# Altium schematic sheet Sensors.SchDoc
size A3; SheetNumber: 4; SheetTotal: 6
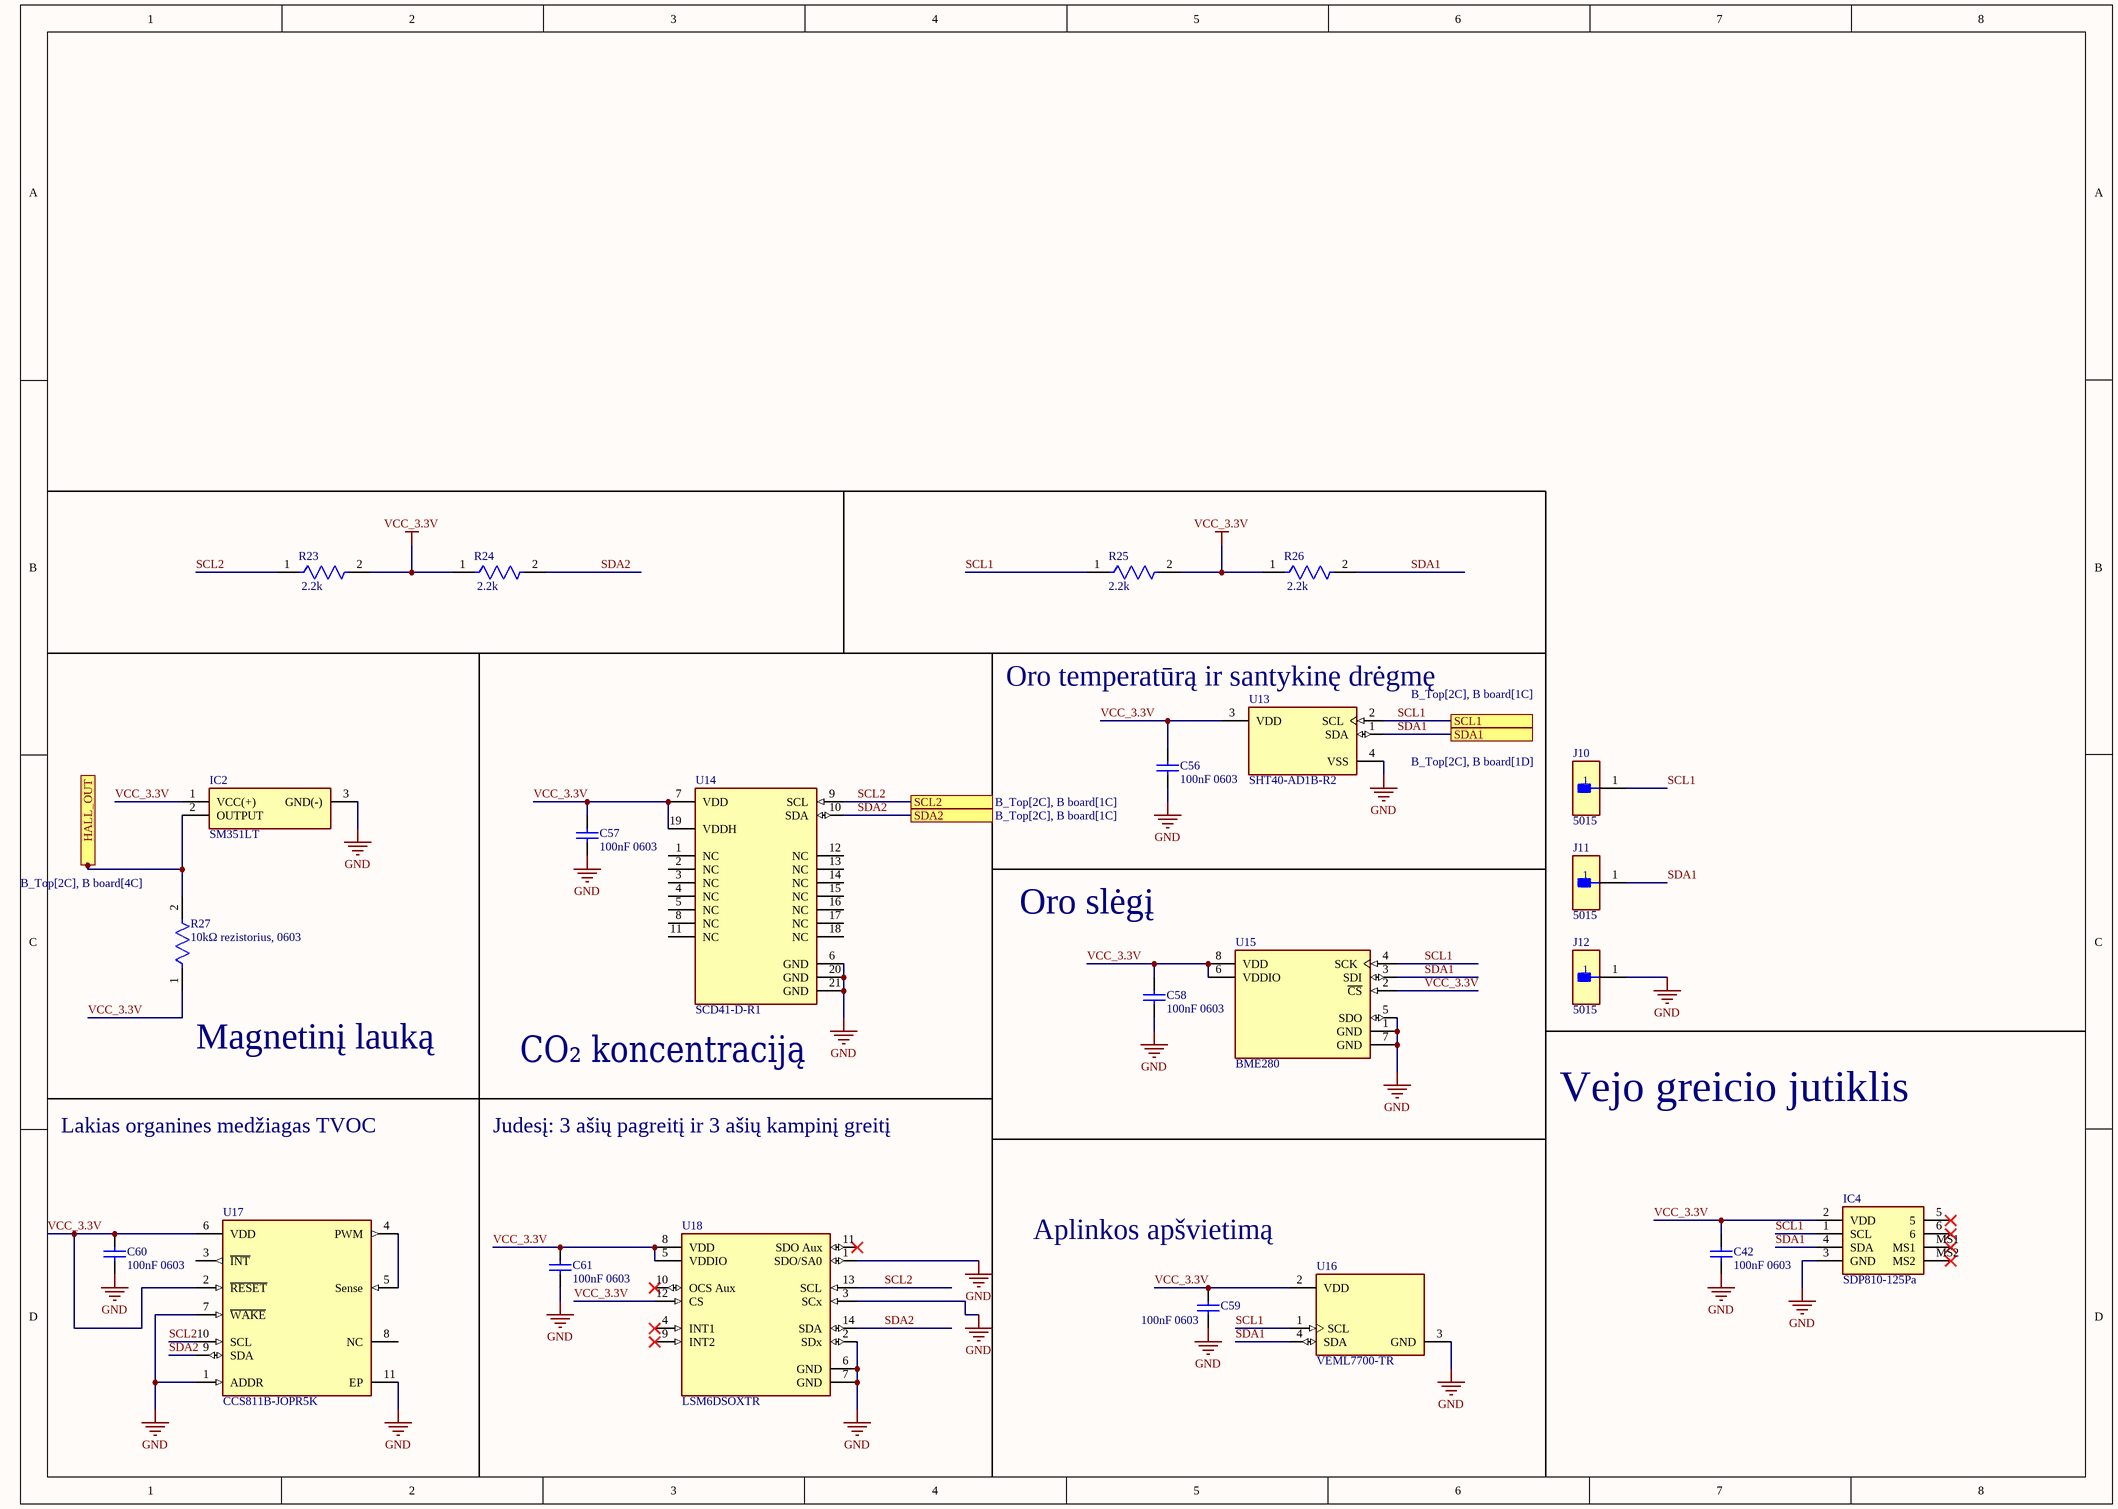
[diagram p0: Sensors.SchDoc]

## Parts
C42  100nF 0603  [CAPC1608X90X35NL15T15]
C56  100nF 0603  [CAPC1608X90X35NL15T15]
C57  100nF 0603  [CAPC1608X90X35NL15T15]
C58  100nF 0603  [CAPC1608X90X35NL15T15]
C59  100nF 0603  [CAPC1608X90X35NL15T15]
C60  100nF 0603  [CAPC1608X90X35NL15T15]
C61  100nF 0603  [CAPC1608X90X35NL15T15]
IC2  SM351LT  [SOT95P280X140-3N]
IC4  SDP810-125Pa  [SDP810125Pa]
J10  5015  [FP-5015-MFG]
J11  5015  [FP-5015-MFG]
J12  5015  [FP-5015-MFG]
R23  2.2k  [FP-RMCF0603-IPC_C]
R24  2.2k  [FP-RMCF0603-IPC_C]
R25  2.2k  [FP-RMCF0603-IPC_C]
R26  2.2k  [FP-RMCF0603-IPC_C]
R27  10kΩ rezistorius, 0603  [FP-AC0603-MFG]
U13  SHT40-AD1B-R2  [FP-SHT40-AD1B-R2-MFG]
U14  SCD41-D-R1  [FP-SCD41-D-R1-MFG]
U15  BME280  [FP-BME280-MFG]
U16  VEML7700-TR  [FP-6_550-5300_02-4-MFG]
U17  CCS811B-JOPR5K  [FP-CCS811B-JOPR5K-MFG]
U18  LSM6DSOXTR  [FP-LGA-14L-DM00249496-MFG]

## Ports
HALL_OUT (see B_Top[2C], B board[4C]), SCL1 (see B_Top[2C], B board[1C]), SCL2 (see B_Top[2C], B board[1C]), SDA1 (see B_Top[2C], B board[1D]), SDA2 (see B_Top[2C], B board[1C])

## Nets
GND: C42.1 C56.1 C57.1 C58.1 C59.1 C60.1 C61.1 IC2.3(GND(-)) IC4.3(GND) J12.1 U13.4(VSS) U14.6(GND) U14.20(GND) U14.21(GND) U15.1(GND) U15.5(SDO) U15.7(GND) U16.3(GND) U17.1(ADDR) U17.7(~{WAKE}) U17.11(EP) U18.1(SDO/SA0) U18.2(SDx) U18.3(SCx) U18.6(GND) U18.7(GND)
VCC_3.3V: C42.2 C56.2 C57.2 C58.2 C59.2 C60.2 C61.2 IC2.1(VCC(+)) IC4.2(VDD) R23.2 R24.1 R25.2 R26.1 R27.1 U13.3(VDD) U14.7(VDD) U14.19(VDDH) U15.2(~{CS}) U15.6(VDDIO) U15.8(VDD) U16.2(VDD) U17.2(~{RESET}) U17.6(VDD) U18.5(VDDIO) U18.8(VDD) U18.12(CS)
HALL_OUT: IC2.2(OUTPUT) R27.2 ; port HALL_OUT
SCL1: IC4.1(SCL) J10.1 R25.1 U13.2(SCL) U15.4(SCK) U16.1(SCL) ; port SCL1
SCL2: R23.1 U14.9(SCL) U17.10(SCL) U18.13(SCL) ; port SCL2
SDA1: IC4.4(SDA) J11.1 R26.2 U13.1(SDA) U15.3(SDI) U16.4(SDA) ; port SDA1
SDA2: R24.2 U14.10(SDA) U17.9(SDA) U18.14(SDA) ; port SDA2
NetU17_4: U17.4(PWM) U17.5(Sense)

Not connected (* = marked no-connect by the designer): IC4 5* 6* MS1* MS2*; U14 1(NC) 2(NC) 3(NC) 4(NC) 5(NC) 8(NC) 11(NC) 12(NC) 13(NC) 14(NC) 15(NC) 16(NC) 17(NC) 18(NC); U17 3(~{INT}) 8(NC); U18 4(INT1)* 9(INT2)* 10(OCS_Aux)* 11(SDO_Aux)*

## Notes on the sheet
- (near U13) Oro temperatūrą ir santykinę drėgmę
- Oro slėgį
- Magnetinį lauką
- (near U14) CO₂ koncentraciją
- Vejo greicio jutiklis
- Lakias organines medžiagas TVOC
- Judesį: 3 ašių pagreitį ir 3 ašių kampinį greitį
- Aplinkos apšvietimą

## Library data of the parts
C42 C56-C61 = CMP-2006-02299-1: Part Number: C0603C104K4RAC7013; Manufacturer: Kemet
IC2 = SM351LT: Integrated Circuit; Manufacturer_Name: Honeywell; Datasheet Link: https://sensing.honeywell.com/honeywell-sensing-nanopower-series-datasheet-50095501-c-en.pdf; Height: 1.4mm; Manufacturer_Part_Number: SM351LT; Mouser Part Number: 785-SM351LT; Mouser Price/Stock: https://www.mouser.co.uk/ProductDetail/Honeywell/SM351LT?qs=sJdZgDoFdSUOIFPguWQjqw%3D%3D; Arrow Part Number: SM351LT; Arrow Price/Stock: https://www.arrow.com/en/products/sm351lt/honeywell?utm_currency=USD&region=europe
IC4 = SDP810-125Pa: Integrated Circuit; Manufacturer_Name: Sensirion; Datasheet Link: https://www.mouser.kr/datasheet/2/682/seri_s_a0008130567_1-2291061.pdf; Height: 24mm; Manufacturer_Part_Number: SDP810-125Pa; Mouser Part Number: 403-SDP810-125PA; Mouser Price/Stock: https://www.mouser.co.uk/ProductDetail/Sensirion/SDP810-125PA?qs=KwaGCOX4wIaNl5Uit0G7rw%3D%3D; Arrow Part Number: SDP810-125PA; Arrow Price/Stock: https://www.arrow.com/en/products/sdp810-125pa/sensirion-ag?region=europe
J10-J12 = CMP-2000-05183-2: PC TEST POINT MINIATURE; Manufacturer: keystone; Number Of Contacts: 1; Conn Orientation: Straight; Category: Conn; Manufacturer Part Number: 5015; Digikey Description: PC TEST POINT MINIATURE; Automotive: No; Lead Free: Yes; Octopart: https://octopart.com/5015-keystone-3822; ComponentLink2URL: http://www.keyelco.com/product-pdf.cfm?p=1353; Package: 5015; RoHS: TRUE; Device Class L3: unset; Device Class L2: unset; Contact Material: Silver; Device Class L1: Connectors; Height: 1.65mm; ComponentLink2Description: Datasheet
R23-R26 = CMP-26527-001021-1: 2.2kΩ ±1% 0.1W 0603 Thick Film Chip Resistor AEC-Q200 compliant; Resistance: 2.2kR; Temperature Coefficient: 100ppm/°C; Min Operating Temperature: -55°C; Mount: Surface Mount; Radiation Hardening: No; Case/Package: 0603; RoHS Compliant: Yes; Tolerance: 1%; Contact Plating: Tin; Max Operating Temperature: 155°C; Packaging: Tape and Reel; Resistor Type: Thick Film
R27 = CMP-03412-024106-2: RES 10KΩ 0.50% 0.1W 0603; RoHS Compliant: Yes
U13 = CMP-144040-000008-1: SENSOR HUMIDITY 100 RH SMD
U14 = CMP-144026-000007-1: CO2 SENSOR 40 PPM I2C SMD
U15 = CMP-2000-05073-3: SENSOR PRESSURE HUMIDITY TEMP; Sensor Type: Temperature; Accuracy: 3%; Response Time: 1s; Output Type: SPI; Min Operating Temperature: -40°C; Max Operating Temperature: 85°C; Case/Package: LGA; Packaging: Cut Tape; Mount: Surface Mount; Lead Free: Lead Free; Number of Pins: 8
U16 = CMP-02530-000005-1: SENSOR OPT 545NM AMBIENT 4SMD; Manufacturer: Vishay; Sensor Output: I2C; Max Supply Voltage: 3.6V; Operating Supply Current: 2-45uA; Min Supply Voltage: 2.5V; Max Junction Temp: +100°C; Height: 3.15mm; Category: IC; Automotive: No; Ambient Temperature Range Low: -25°C; Octopart: https://octopart.com/veml7700-tr-vishay-70519713; Ambient Temperature Range High: +85°C; Lead Free: Yes; Manufacturer Part Number: VEML7700-TR; Device Class L3: unset; Temperature Range High: +100°C; ComponentLink2URL: http://www.vishay.com/docs/84286/veml7700.pdf; Package: 6.550-5300.02-4; Digikey Description: SENSOR OPT 545NM AMBIENT 4SMD; Device Class L2: Optical Sensors; RoHS: TRUE; Temperature: to +100°C; ComponentLink2Description: Datasheet; Device Class L1: Sensors
U17 = CMP-22823-000001-1: CCS811B-JOPR5K LGA10 LF T&R; Operating Supply Current: 26mA; Min Operating Temperature: -5°C; Max Operating Temperature: 50°C
U18 = CMP-12177-000010-1: INEMO INERTIAL MODULE: 3D ACCELE; Manufacturer: STMicroelectronics; Sensor Type: Temperature,Accelerometer,Gyroscope; Accel Range: 2/4/8/16g; Accel Sensitivity: 0.061/0.122/0.244/0.488mV/g; Operating Supply Current: 0.55mA; Gyro Range: 125/250/500/1000/2000°/s; Gyro Sensitivity: 4.375/8.75/17.5/35/70LSB/°/s; Sensor Output: I2C,SPI,Other; Min Supply Voltage: 1.62V; Max Supply Voltage: 3.6V; Octopart: https://octopart.com/lsm6dsoxtr-stmicroelectronics-98102600; Package: LGA-14L-DM00249496; Footprint Url: https://www.st.com/content/ccc/resource/technical/document/technical_note/73/17/9c/16/dd/96/4a/01/CD00134799.pdf/files/CD00134799.pdf/jcr:content/translations/en.CD00134799.pdf; ComponentLink2Description: Datasheet; Mouser Description: LSM6DSOX: 3.6 V 3 Axis Accelerometer Gyroscope iNEMO Inertial Module - LGA-14L; ComponentLink2URL: https://www.st.com/resource/en/datasheet/lsm6dsox.pdf; Temperature Range Low: -40°C; Digikey Description: INEMO INERTIAL MODULE: 3D ACCELE; Lead Free: Yes; Device Class L3: Inertial Measurement Units (IMUs); Category: IC; Device Class L2: Motion Sensors; RoHS: TRUE; Temperature: -40°C to +85°C; Height: 0.86mm; Device Class L1: Sensors; Temperature Range High: +85°C; Manufacturer Part Number: LSM6DSOXTR; Automotive: No